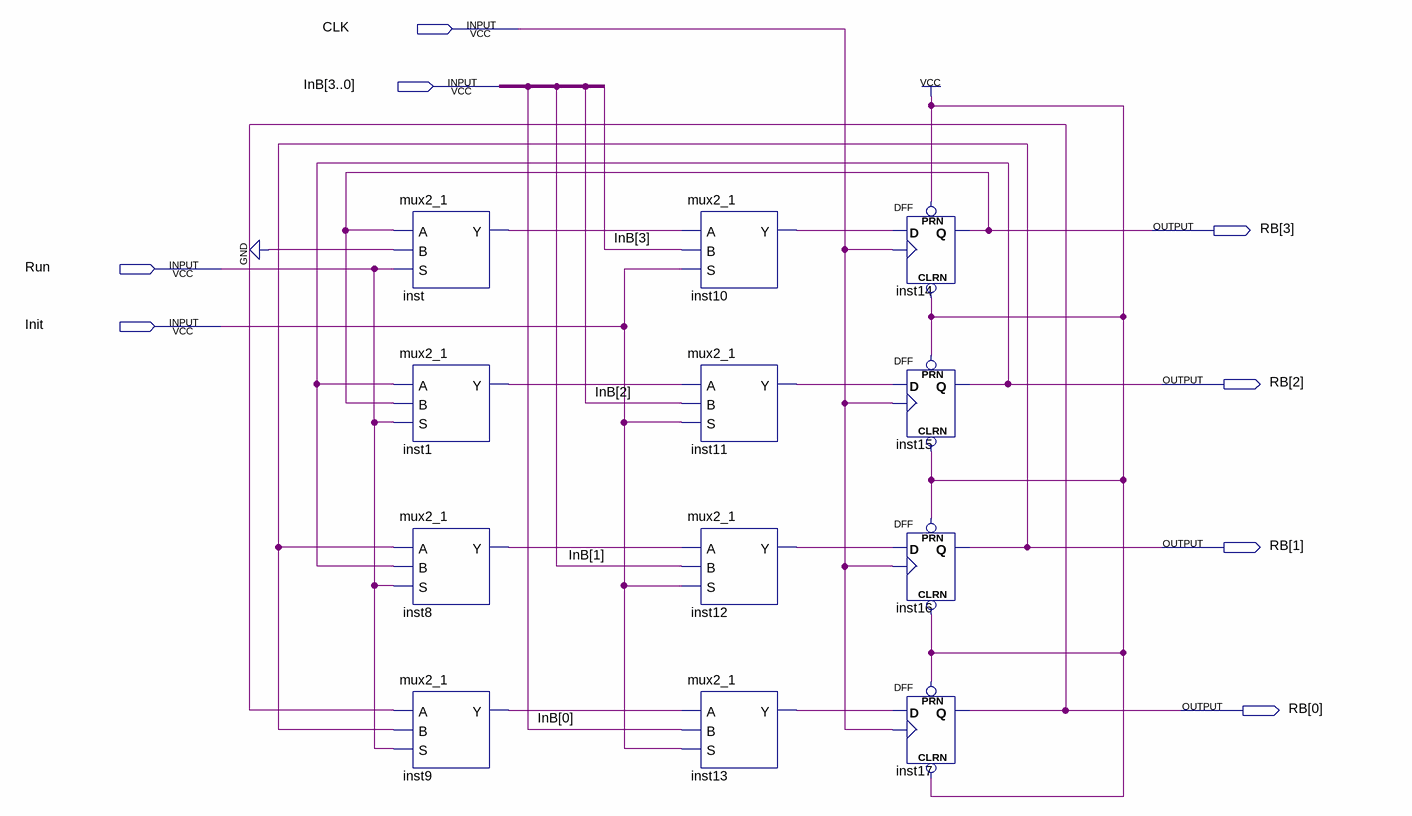
[diagram p0: schematic sheet]
// Quartus schematic RegB.bdf as structural Verilog: 12 symbols, 8 pins
module RegB (
  input  CLK,
  input  [3:0] InB,
  input  Run,
  input  Init,
  output [3:0] RB
);

  wire inst1_y, inst8_y, inst9_y, inst10_y, inst11_y, inst12_y, inst13_y, inst_y;

  mux2_1 inst (.A(RB[3]), .B(1'b0), .S(Run), .Y(inst_y));
  mux2_1 inst1 (.A(RB[2]), .B(RB[3]), .S(Run), .Y(inst1_y));
  mux2_1 inst8 (.A(RB[1]), .B(RB[2]), .S(Run), .Y(inst8_y));
  mux2_1 inst9 (.A(RB[0]), .B(RB[1]), .S(Run), .Y(inst9_y));
  mux2_1 inst10 (.A(inst_y), .B(InB[3]), .S(Init), .Y(inst10_y));
  mux2_1 inst11 (.A(inst1_y), .B(InB[2]), .S(Init), .Y(inst11_y));
  mux2_1 inst12 (.A(inst8_y), .B(InB[1]), .S(Init), .Y(inst12_y));
  mux2_1 inst13 (.A(inst9_y), .B(InB[0]), .S(Init), .Y(inst13_y));
  DFF inst14 (.CLRN(1'b1), .CLK(CLK), .D(inst10_y), .PRN(1'b1), .Q(RB[3]));
  DFF inst15 (.CLRN(1'b1), .CLK(CLK), .D(inst11_y), .PRN(1'b1), .Q(RB[2]));
  DFF inst16 (.CLRN(1'b1), .CLK(CLK), .D(inst12_y), .PRN(1'b1), .Q(RB[1]));
  DFF inst17 (.CLRN(1'b1), .CLK(CLK), .D(inst13_y), .PRN(1'b1), .Q(RB[0]));
endmodule
